# Altium schematic sheet 02A_POWER_RAILS.SchDoc: Схема электрическая принципиальная
size 420 x 297 mm; ApprovedBy: Скрябин; CheckedBy: Скрябин; Author: Корсунов; CompanyName: РТУ МИРЭА; SheetNumber: 2; SheetTotal: 11; PageSetup: Record=PageOptions|CenterHorizontal=True|CenterVertical=True|PrintScale=0.94|XCorrection=1.00|YCorrection=1.00|PrintKind=1|BorderSize=5000000|LeftOffset=0|BottomOffset=0|Orientation=1|PaperLength=1000|PaperWidth=1000|Scale=100|PaperSource=7|PrintQuality=-4|MediaType=1|DitherType=10|PaperKind=A4|PrintScaleMode=1; DecimalNumber: RP23.000001.002 Э3; Name1: Модуль ввода-вывода; lit_A: О; Name2: RP2350 OPC UA
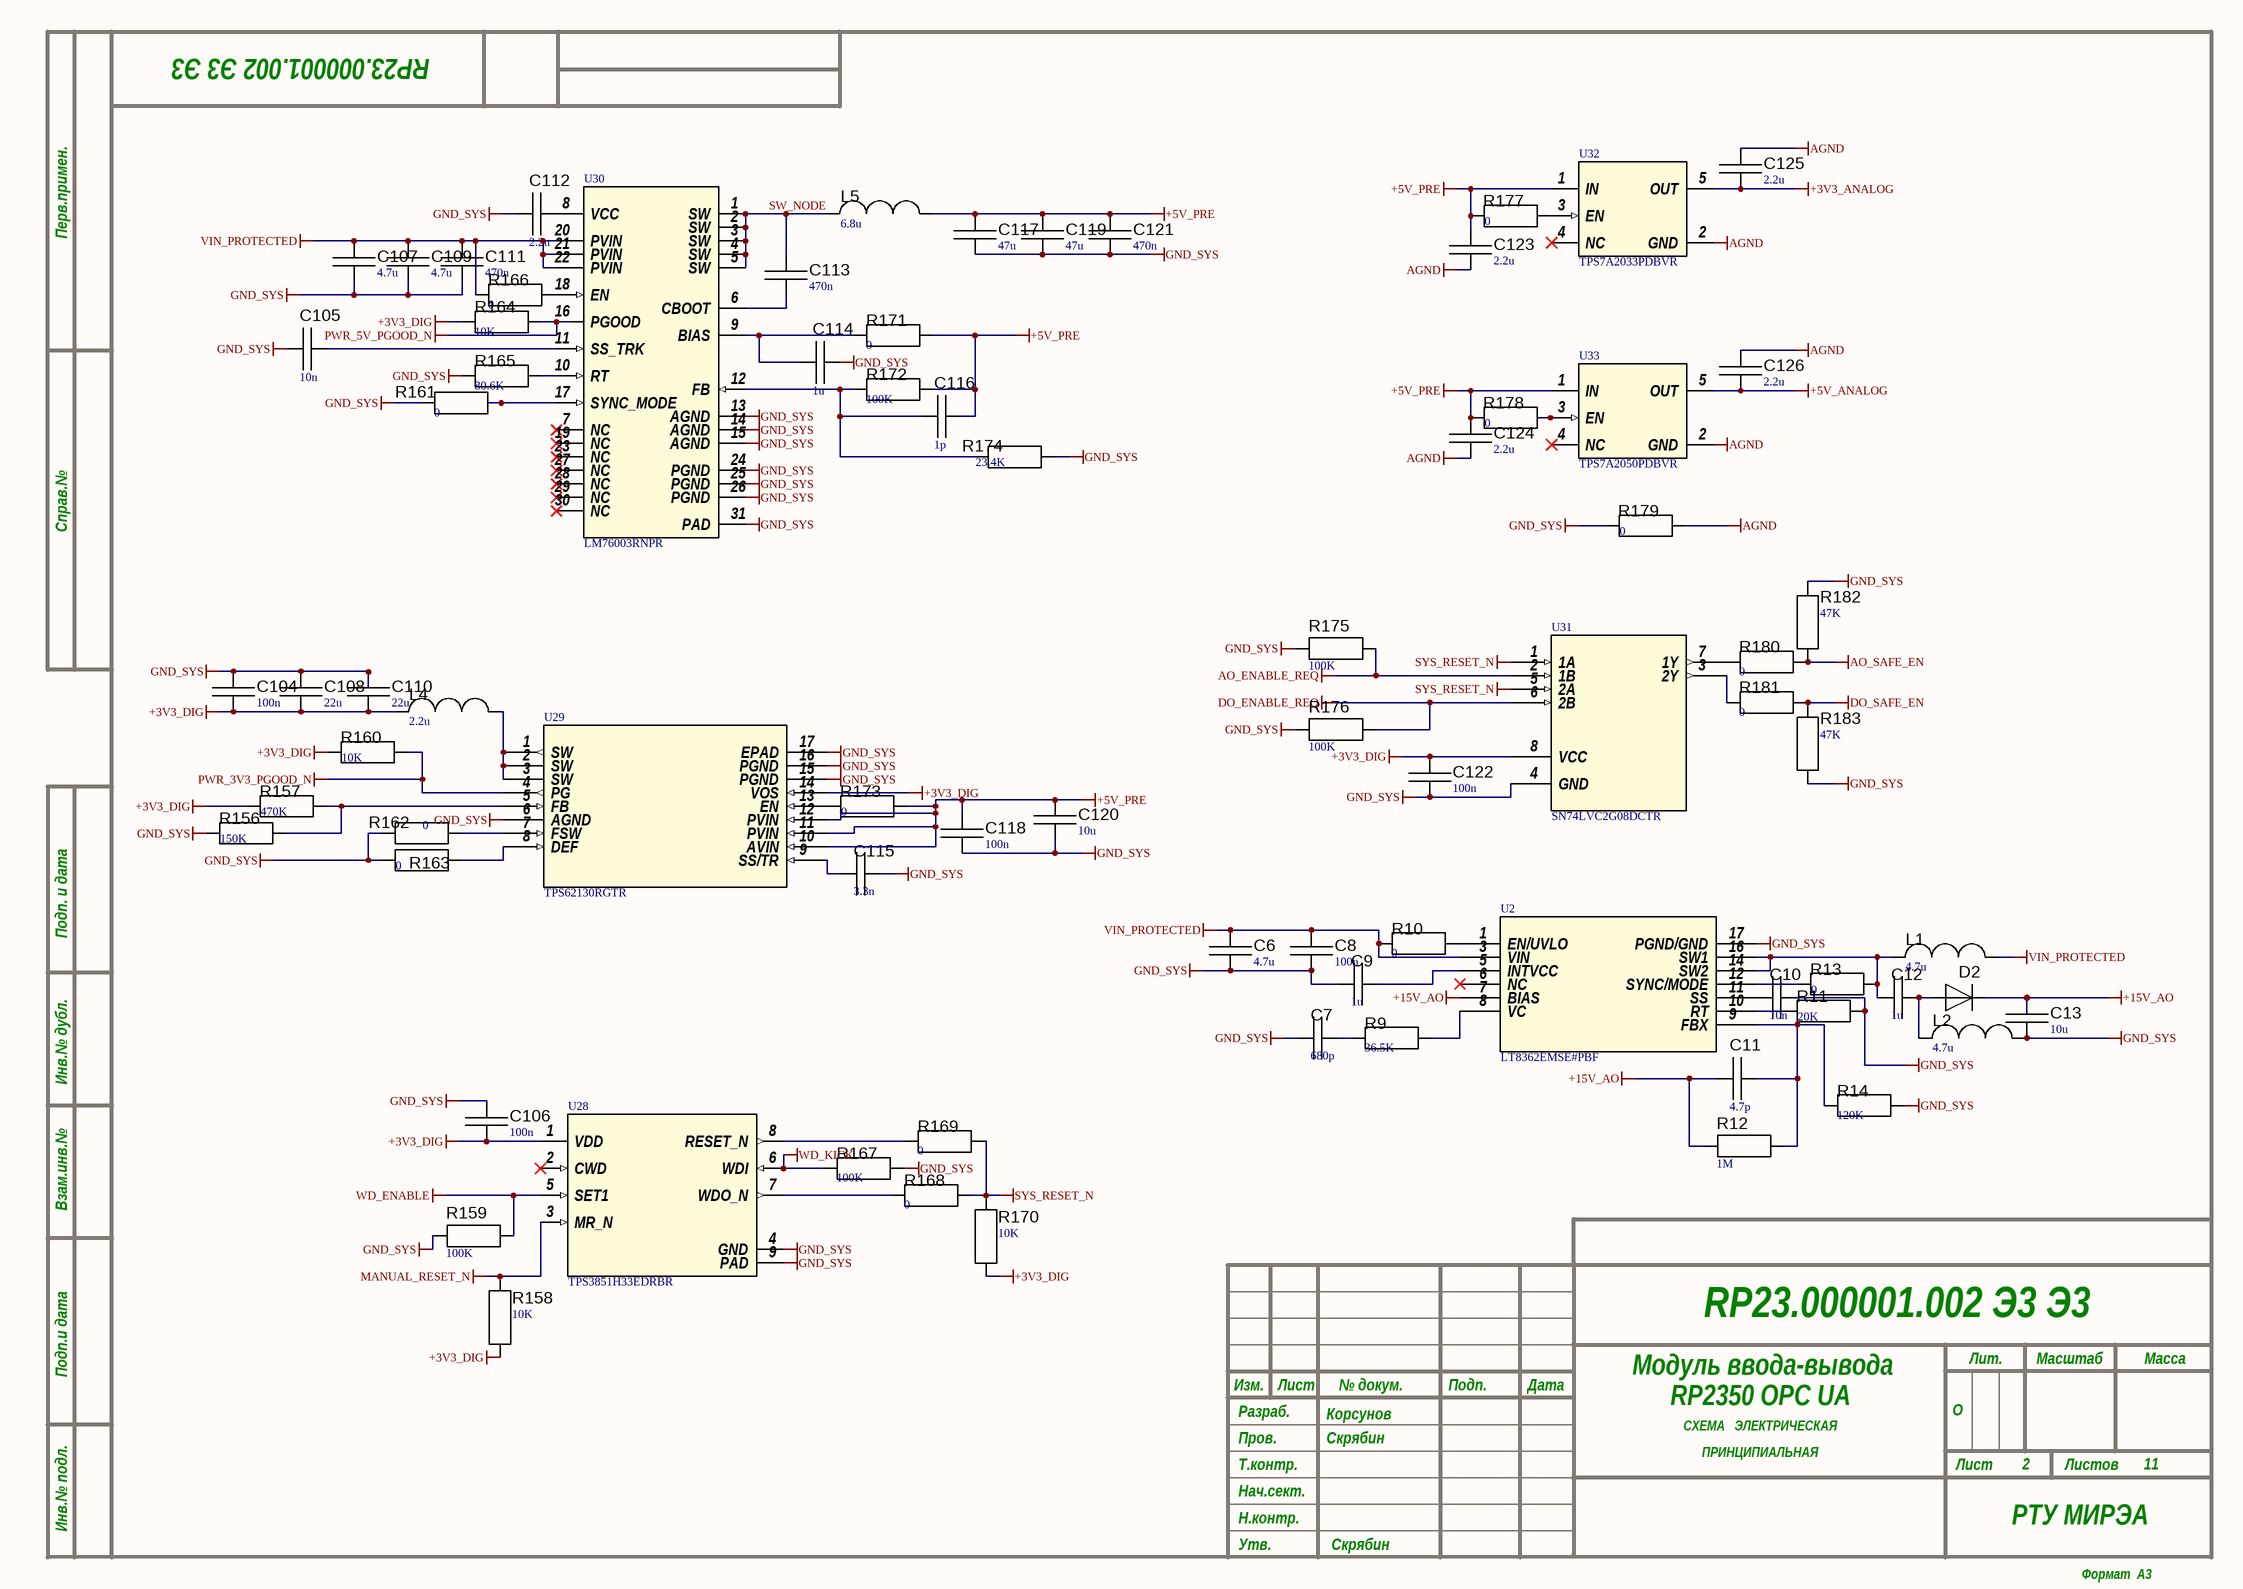
[diagram p0: 02A_POWER_RAILS.SchDoc]

## Parts
C6  value 4.7u  [C_1206]  (hidden comment: Capacitor)
C7  value 680p  [C_0603]  (hidden comment: Capacitor)
C8  value 100n  [C_0805]  (hidden comment: Capacitor)
C9  value 1u  [C_0603]  (hidden comment: Capacitor)
C10  value 10n  [C_0603]  (hidden comment: Capacitor)
C11  value 4.7p  [C_0603]  (hidden comment: Capacitor)
C12  value 1u  [C_1206]  (hidden comment: Capacitor)
C13  value 10u  [C_1206]  (hidden comment: Capacitor)
C104  value 100n  [C_0805]  (hidden comment: Capacitor)
C105  value 10n  [C_0603]  (hidden comment: Capacitor)
C106  value 100n  [C_0805]  (hidden comment: Capacitor)
C107  value 4.7u  [C_1206]  (hidden comment: Capacitor)
C108  value 22u  [C_1210]  (hidden comment: Capacitor)
C109  value 4.7u  [C_1206]  (hidden comment: Capacitor)
C110  value 22u  [C_1210]  (hidden comment: Capacitor)
C111  value 470n  [C_0805]  (hidden comment: Capacitor)
C112  value 2.2u  [C_0603]  (hidden comment: Capacitor)
C113  value 470n  [C_0805]  (hidden comment: Capacitor)
C114  value 1u  [C_0603]  (hidden comment: Capacitor)
C115  value 3.3n  [C_0603]  (hidden comment: Capacitor)
C116  value 1p  [C_0603]  (hidden comment: Capacitor)
C117  value 47u  [C_1210]  (hidden comment: Capacitor)
C118  value 100n  [C_0805]  (hidden comment: Capacitor)
C119  value 47u  [C_1210]  (hidden comment: Capacitor)
C120  value 10u  [C_1206]  (hidden comment: Capacitor)
C121  value 470n  [C_0805]  (hidden comment: Capacitor)
C122  value 100n  [C_0805]  (hidden comment: Capacitor)
C123  value 2.2u  [C_0603]  (hidden comment: Capacitor)
C124  value 2.2u  [C_0603]  (hidden comment: Capacitor)
C125  value 2.2u  [C_0603]  (hidden comment: Capacitor)
C126  value 2.2u  [C_0603]  (hidden comment: Capacitor)
D2  Schottky Diode  [D_POWERDI123]  (value not drawn)
L1  value 4.7u  [L_XGL4020]  (hidden comment: Inductor)
L2  value 4.7u  [L_XGL4020]  (hidden comment: Inductor)
L4  value 2.2u  [L_XFL4020]  (hidden comment: Inductor)
L5  value 6.8u  [L_XGL6030]  (hidden comment: Inductor)
R9  value 36.5K  [R_0805]  (hidden comment: Resistor)
R10  value 0  [R_0805]  (hidden comment: Resistor)
R11  value 20K  [R_0805]  (hidden comment: Resistor)
R12  value 1M  [R_0805]  (hidden comment: Resistor)
R13  value 0  [R_0805]  (hidden comment: Resistor)
R14  value 120K  [R_0805]  (hidden comment: Resistor)
R156  value 150K  [R_0805]  (hidden comment: Resistor)
R157  value 470K  [R_0805]  (hidden comment: Resistor)
R158  value 10K  [R_0805]  (hidden comment: Resistor)
R159  value 100K  [R_0805]  (hidden comment: Resistor)
R160  value 10K  [R_0805]  (hidden comment: Resistor)
R161  value 0  [R_0805]  (hidden comment: Resistor)
R162  value 0  [R_0805]  (hidden comment: Resistor)
R163  value 0  [R_0805]  (hidden comment: Resistor)
R164  value 10K  [R_0805]  (hidden comment: Resistor)
R165  value 80.6K  [R_0805]  (hidden comment: Resistor)
R166  value 0  [R_0805]  (hidden comment: Resistor)
R167  value 100K  [R_0805]  (hidden comment: Resistor)
R168  value 0  [R_0805]  (hidden comment: Resistor)
R169  value 0  [R_0805]  (hidden comment: Resistor)
R170  value 10K  [R_0805]  (hidden comment: Resistor)
R171  value 0  [R_0805]  (hidden comment: Resistor)
R172  value 100K  [R_0805]  (hidden comment: Resistor)
R173  value 0  [R_0805]  (hidden comment: Resistor)
R174  value 23.4K  [R_0805]  (hidden comment: Resistor)
R175  value 100K  [R_0805]  (hidden comment: Resistor)
R176  value 100K  [R_0805]  (hidden comment: Resistor)
R177  value 0  [R_0805]  (hidden comment: Resistor)
R178  value 0  [R_0805]  (hidden comment: Resistor)
R179  value 0  [R_0805]  (hidden comment: Resistor)
R180  value 0  [R_0805]  (hidden comment: Resistor)
R181  value 0  [R_0805]  (hidden comment: Resistor)
R182  value 47K  [R_0805]  (hidden comment: Resistor)
R183  value 47K  [R_0805]  (hidden comment: Resistor)
U2  LT8362EMSE#PBF  [MSE_16A_ADI]
U28  TPS3851H33EDRBR  [DRB0008A]
U29  TPS62130RGTR  [RGT16_1P7X1P7]
U30  LM76003RNPR  [RNP0030B]
U31  SN74LVC2G08DCTR  [DCT8]
U32  TPS7A2033PDBVR  [DBV0005A-IPC_A]
U33  TPS7A2050PDBVR  [DBV0005A-IPC_A]

## Nets
+3V3_ANALOG: C125.1 U32.5(OUT)
+3V3_DIG: C104.1 C106.1 C108.1 C110.1 C122.2 L4.1 R157.1 R158.1 R160.1 R164.1 R170.1 U28.1(VDD) U29.14(VOS) U31.8(VCC)
+5V_ANALOG: C126.1 U33.5(OUT)
+5V_PRE: C116.1 C117.2 C118.1 C119.2 C120.1 C121.2 C123.2 C124.2 L5.2 R171.2 R172.2 R173.2 R177.1 R178.1 U29.10(AVIN) U29.11(PVIN) U29.12(PVIN) U32.1(IN) U33.1(IN)
+15V_AO: C11.2 C13.2 D2.2(C) R12.2 U2.7(BIAS)
AGND: C123.1 C124.1 C125.2 C126.2 R179.2 U32.2(GND) U33.2(GND)
AO_ENABLE_REQ: R175.1 U31.2(1B)
AO_SAFE_EN: R180.2 R182.1
DO_ENABLE_REQ: R176.1 U31.6(2B)
DO_SAFE_EN: R181.2 R183.2
GND_SYS: C6.1 C7.1 C8.1 C9.1 C10.2 C13.1 C104.2 C105.2 C106.2 C107.1 C108.2 C109.1 C110.2 C111.1 C112.2 C114.1 C115.2 C117.1 C118.2 C119.1 C120.2 C121.1 C122.1 L2.2 R11.2 R14.2 R156.1 R159.2 R161.1 R162.1 R163.1 R165.1 R167.2 R174.2 R175.2 R176.2 R179.1 R182.2 R183.1 U2.17(PGND/GND) U28.4(GND) U28.9(PAD) U29.6(AGND) U29.15(PGND) U29.16(PGND) U29.17(EPAD) U30.13(AGND) U30.14(AGND) U30.15(AGND) U30.24(PGND) U30.25(PGND) U30.26(PGND) U30.31(PAD) U31.4(GND)
MANUAL_RESET_N: R158.2 U28.3(MR_N)
PWR_3V3_PGOOD_N: R160.2 U29.4(PG)
PWR_5V_PGOOD_N: R164.2 U30.16(PGOOD)
SYS_RESET_N: R168.2 R169.2 R170.2 U31.1(1A) U31.5(2A)
VIN_PROTECTED: C6.2 C8.2 C107.2 C109.2 C111.2 L1.2 R10.1 R166.1 U2.3(VIN) U30.20(PVIN) U30.21(PVIN) U30.22(PVIN)
WD_ENABLE: R159.1 U28.5(SET1)
WD_KICK: R167.1 U28.6(WDI)
SW_NODE: C113.2 L5.1 U30.1(SW) U30.2(SW) U30.3(SW) U30.4(SW) U30.5(SW)
NetC7_2: C7.2 R9.1
NetC9_2: C9.2 U2.5(INTVCC)
NetC10_1: C10.1 U2.11(SS)
NetC11_1: C11.1 R12.1 R14.1 U2.9(FBX)
NetC12_1: C12.1 L1.1 R13.2 U2.14(SW2) U2.16(SW1)
NetC12_2: C12.2 D2.1(A) L2.1
NetC105_1: C105.1 U30.11(SS_TRK)
NetC112_1: C112.1 U30.8(VCC)
NetC113_1: C113.1 U30.6(CBOOT)
NetC114_2: C114.2 R171.1 U30.9(BIAS)
NetC115_1: C115.1 U29.9(SS/TR)
NetC116_2: C116.2 R172.1 R174.1 U30.12(FB)
NetL4_2: L4.2 U29.1(SW) U29.2(SW) U29.3(SW)
NetR9_2: R9.2 U2.8(VC)
NetR10_2: R10.2 U2.1(EN/UVLO)
NetR11_1: R11.1 U2.10(RT)
NetR13_1: R13.1 U2.12(SYNC/MODE)
NetR156_2: R156.2 R157.2 U29.5(FB)
NetR161_2: R161.2 U30.17(SYNC_MODE)
NetR162_2: R162.2 U29.7(FSW)
NetR163_2: R163.2 U29.8(DEF)
NetR165_2: R165.2 U30.10(RT)
NetR166_2: R166.2 U30.18(EN)
NetR168_1: R168.1 U28.7(WDO_N)
NetR169_1: R169.1 U28.8(RESET_N)
NetR173_1: R173.1 U29.13(EN)
NetR177_2: R177.2 U32.3(EN)
NetR178_2: R178.2 U33.3(EN)
NetR180_1: R180.1 U31.7(1Y)
NetR181_1: R181.1 U31.3(2Y)

Not connected (* = marked no-connect by the designer): U2 6(NC)*; U28 2(CWD)*; U30 7(NC)* 19(NC)* 23(NC)* 27(NC)* 28(NC)* 29(NC)* 30(NC)*; U32 4(NC)*; U33 4(NC)*

## Notes on the sheet
- Перв.примен.
- Справ.№
- Подп. и дата
- Инв.№ дубл.
- Взам.инв.№
- Подп.и дата
- Разраб.
- Изм.
- Лист
- № докум.
- Подп.
- Дата
- Лит.
- Масштаб
- Масса
- Т.контр.
- Пров.
- СХЕМА   ЭЛЕКТРИЧЕСКАЯ
- ПРИНЦИПИАЛЬНАЯ
- Листов
- Инв.№ подл.
- Утв.
- Н.контр.
- Нач.сект.
- Формат  A3

## Library data of the parts
C6-C13 C104-C126 = Capacitor: SimulationGenericComponent: True
D2 = Schottky Diode: AF: 1; BV: 0; BV_MAX: 1e99; EG: 1.11; FC: 0.5; IBV: 0.001; IS: 1e-14; MJSW: 0.33; NTUN: 30; TNOM: 27; XTI: 3; SimulationGenericComponent: True; CJO: 0; CJP: 0; CTA: 0; CTP: 0; FCS: 0.5; FV_MAX: 1e99; IKF: 0; IKR: 0; ISR: 1e-14; JSW: 0; JTUN: 0; JTUNSW: 0; KEG: 1; KF: 0; LEVEL: 1; N: 1; NBV: 1; NR: 1; NS: 1; PHP: 1; RS: 0; TCV: 0; TLEV: 0; TLEVC: 0; TM1: 0; TM2: 0; TPB: 0; TPHP: 0; TRS: 0; TRS2: 0; TT: 0; TTT1: 0; TTT2: 0; VJ: 1; XTITUN: 3
L1 L2 L4 L5 = Inductor: SimulationGenericComponent: True
R9 R11 R12 R14 R156-R160 R164 R165 R167 R170 R172 R174-R176 R182 R183 = Resistor: TC1: 0; SimulationGenericComponent: True; TC2: 0
R10 R13 R161-R163 R166 R168 R169 R171 R173 R177-R181 = Resistor: SimulationGenericComponent: True; TC1: 0; TC2: 0
U2 = LT8362EMSEPBF: Low IQ Boost/SEPIC/Inverting Converter with 2A, 60V Switch; Manufacturer_Name: Analog Devices Inc; Copyright: Copyright (C) 2026 Ultra Librarian. All rights reserved.; Manufacturer_Part_Number: LT8362EMSE#PBF; Datasheet: https://www.analog.com/media/en/technical-documentation/data-sheets/lt8362.pdf; RefDes: RefDes; Type: Type
U28 = TPS3851H33EDRBR: High-accuracy voltage supervisor with Integrated watchdog timer 8-SON -40 to 125; Manufacturer_Name: Texas Instruments; TYPE: TYPE; RefDes: RefDes; Copyright: Copyright (C) 2026 Ultra Librarian. All rights reserved.; Manufacturer_Part_Number: TPS3851H33EDRBR; Datasheet: https://www.ti.com/lit/gpn/tps3851
U29 = TPS62130RGTR: 3-17V 3A Step-Down Converter with DCS-Control in 3x3 QFN Package 16-VQFN -40 to 125; Manufacturer_Name: Texas Instruments; Copyright: Copyright (C) 2026 Ultra Librarian. All rights reserved.; Manufacturer_Part_Number: TPS62130RGTR; Datasheet: https://www.ti.com/lit/gpn/tps62130; RefDes: RefDes; Type: Type
U30 = LM76003RNPR: 3.5V to 60V, 3.5A Synchronous Step-Down Voltage Converter 30-WQFN -40 to 125; Manufacturer_Name: Texas Instruments; TYPE: TYPE; RefDes: RefDes; Copyright: Copyright (C) 2025 Ultra Librarian. All rights reserved.; Manufacturer_Part_Number: LM76003RNPR
U31 = SN74LVC2G08DCTR: 2-ch, 2-input 1.65-V to 5.5-V 32 mA drive strength AND gate 8-SSOP -40 to 125; Manufacturer_Name: Texas Instruments; Copyright: Copyright (C) 2026 Ultra Librarian. All rights reserved.; Manufacturer_Part_Number: SN74LVC2G08DCTR; RefDes: RefDes; Type: Type
U32 = TPS7A2033PDBVR: 300mA ultra-low-noise low-IQ low-dropout (LDO) linear regulator with high PSRR 5-SOT-23 -40 to 125; Manufacturer_Name: Texas Instruments; TYPE: TYPE; RefDes: RefDes; Copyright: Copyright (C) 2026 Ultra Librarian. All rights reserved.; Manufacturer_Part_Number: TPS7A2033PDBVR
U33 = TPS7A2050PDBVR: 300mA ultra-low-noise low-IQ low-dropout (LDO) linear regulator with high PSRR 5-SOT-23 -40 to 125; Manufacturer_Name: Texas Instruments; TYPE: TYPE; RefDes: RefDes; Copyright: Copyright (C) 2025 Ultra Librarian. All rights reserved.; Manufacturer_Part_Number: TPS7A2050PDBVR